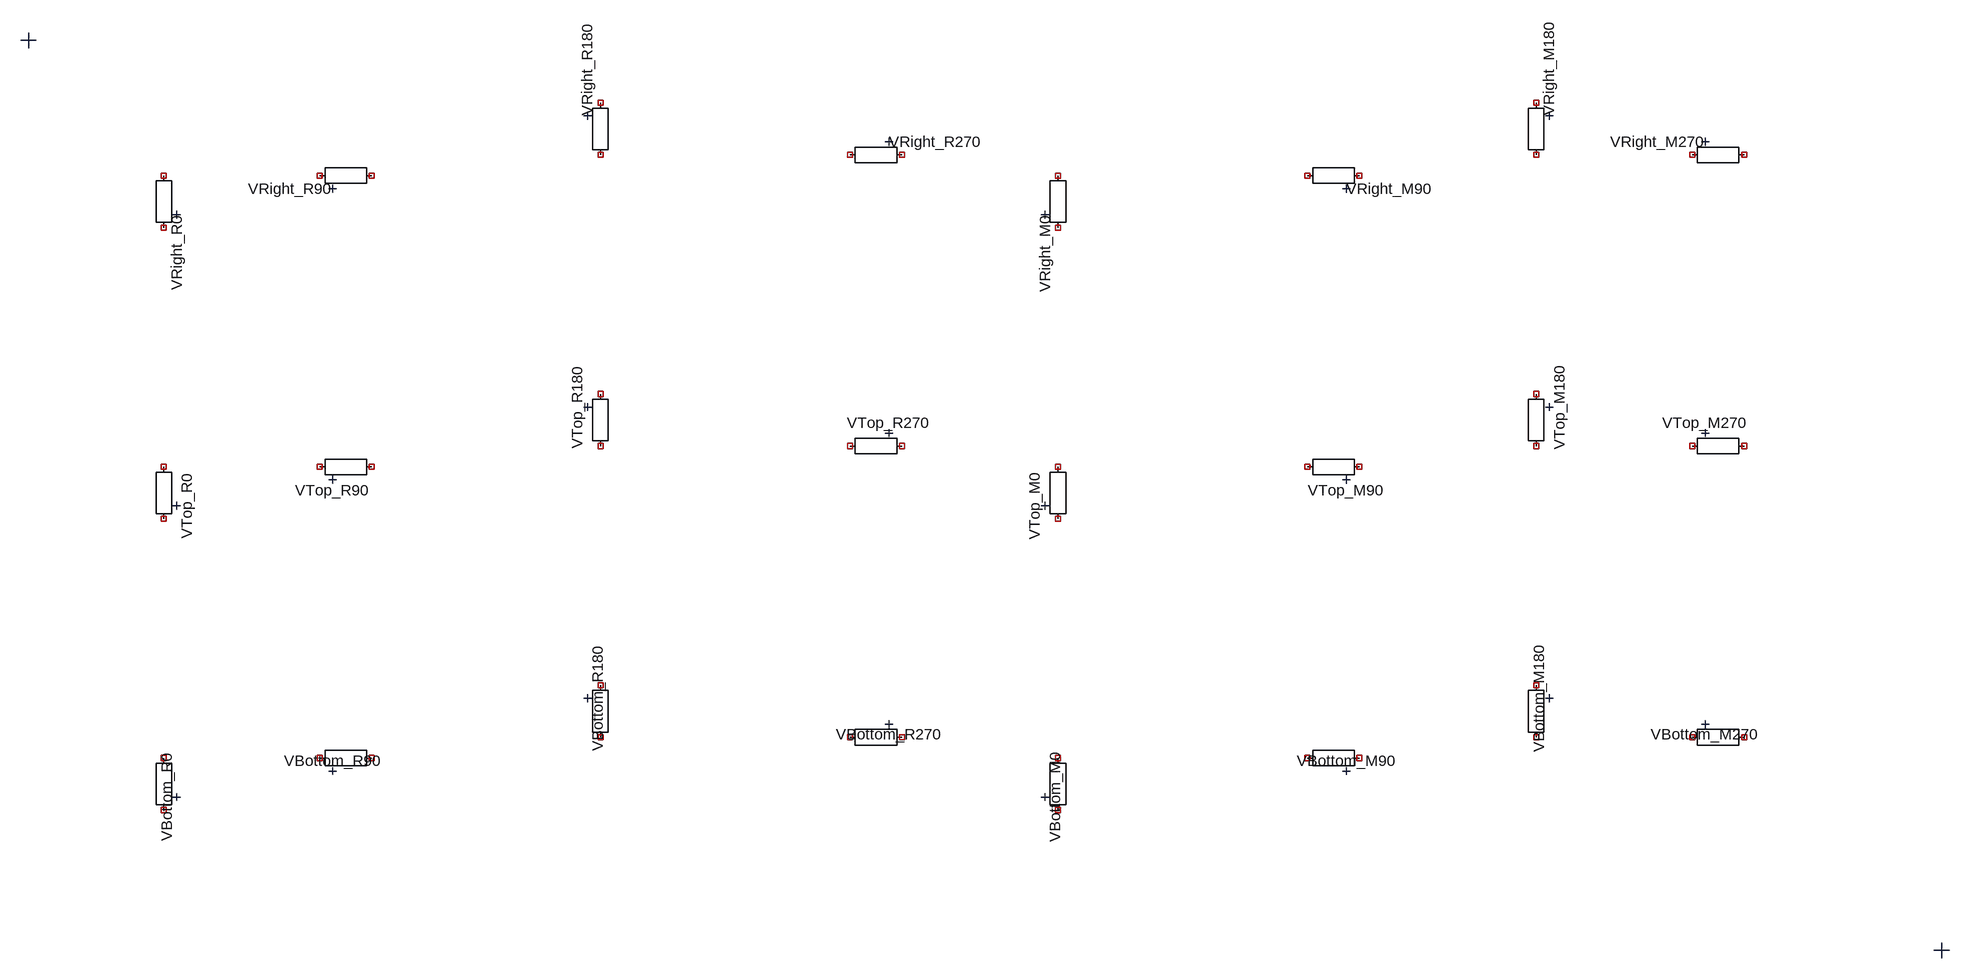
[diagram p0: schematic attributes_vright_vtop_vbottom.asc]
attributes_vright_vtop_vbottom.asc, the LTspice schematic file:
Version 4
SHEET 1 2400 1600
WIRE -12 0 12 0
WIRE 0 -12 0 12
WIRE 2932 1400 2956 1400
WIRE 2944 1388 2944 1412
WIRE 222 268 234 268
WIRE 228 262 228 274
SYMBOL res 192 192 R0
WINDOW 0 0 0 Invisible 2
WINDOW 3 36 76 VRight 2
SYMATTR InstName R1
SYMATTR Value VRight_R0
WIRE 462 228 474 228
WIRE 468 222 468 234
SYMBOL res 544 192 R90
WINDOW 0 0 0 Invisible 2
WINDOW 3 36 76 VRight 2
SYMATTR InstName R2
SYMATTR Value VRight_R90
WIRE 854 116 866 116
WIRE 860 110 860 122
SYMBOL res 896 192 R180
WINDOW 0 0 0 Invisible 2
WINDOW 3 36 76 VRight 2
SYMATTR InstName R3
SYMATTR Value VRight_R180
WIRE 1318 156 1330 156
WIRE 1324 150 1324 162
SYMBOL res 1248 192 R270
WINDOW 0 0 0 Invisible 2
WINDOW 3 36 76 VRight 2
SYMATTR InstName R4
SYMATTR Value VRight_R270
WIRE 1558 268 1570 268
WIRE 1564 262 1564 274
SYMBOL res 1600 192 M0
WINDOW 0 0 0 Invisible 2
WINDOW 3 36 76 VRight 2
SYMATTR InstName R5
SYMATTR Value VRight_M0
WIRE 2022 228 2034 228
WIRE 2028 222 2028 234
SYMBOL res 1952 192 M90
WINDOW 0 0 0 Invisible 2
WINDOW 3 36 76 VRight 2
SYMATTR InstName R6
SYMATTR Value VRight_M90
WIRE 2334 116 2346 116
WIRE 2340 110 2340 122
SYMBOL res 2304 192 M180
WINDOW 0 0 0 Invisible 2
WINDOW 3 36 76 VRight 2
SYMATTR InstName R7
SYMATTR Value VRight_M180
WIRE 2574 156 2586 156
WIRE 2580 150 2580 162
SYMBOL res 2656 192 M270
WINDOW 0 0 0 Invisible 2
WINDOW 3 36 76 VRight 2
SYMATTR InstName R8
SYMATTR Value VRight_M270
WIRE 222 716 234 716
WIRE 228 710 228 722
SYMBOL res 192 640 R0
WINDOW 0 0 0 Invisible 2
WINDOW 3 36 76 VTop 2
SYMATTR InstName R9
SYMATTR Value VTop_R0
WIRE 462 676 474 676
WIRE 468 670 468 682
SYMBOL res 544 640 R90
WINDOW 0 0 0 Invisible 2
WINDOW 3 36 76 VTop 2
SYMATTR InstName R10
SYMATTR Value VTop_R90
WIRE 854 564 866 564
WIRE 860 558 860 570
SYMBOL res 896 640 R180
WINDOW 0 0 0 Invisible 2
WINDOW 3 36 76 VTop 2
SYMATTR InstName R11
SYMATTR Value VTop_R180
WIRE 1318 604 1330 604
WIRE 1324 598 1324 610
SYMBOL res 1248 640 R270
WINDOW 0 0 0 Invisible 2
WINDOW 3 36 76 VTop 2
SYMATTR InstName R12
SYMATTR Value VTop_R270
WIRE 1558 716 1570 716
WIRE 1564 710 1564 722
SYMBOL res 1600 640 M0
WINDOW 0 0 0 Invisible 2
WINDOW 3 36 76 VTop 2
SYMATTR InstName R13
SYMATTR Value VTop_M0
WIRE 2022 676 2034 676
WIRE 2028 670 2028 682
SYMBOL res 1952 640 M90
WINDOW 0 0 0 Invisible 2
WINDOW 3 36 76 VTop 2
SYMATTR InstName R14
SYMATTR Value VTop_M90
WIRE 2334 564 2346 564
WIRE 2340 558 2340 570
SYMBOL res 2304 640 M180
WINDOW 0 0 0 Invisible 2
WINDOW 3 36 76 VTop 2
SYMATTR InstName R15
SYMATTR Value VTop_M180
WIRE 2574 604 2586 604
WIRE 2580 598 2580 610
SYMBOL res 2656 640 M270
WINDOW 0 0 0 Invisible 2
WINDOW 3 36 76 VTop 2
SYMATTR InstName R16
SYMATTR Value VTop_M270
WIRE 222 1164 234 1164
WIRE 228 1158 228 1170
SYMBOL res 192 1088 R0
WINDOW 0 0 0 Invisible 2
WINDOW 3 36 76 VBottom 2
SYMATTR InstName R17
SYMATTR Value VBottom_R0
WIRE 462 1124 474 1124
WIRE 468 1118 468 1130
SYMBOL res 544 1088 R90
WINDOW 0 0 0 Invisible 2
WINDOW 3 36 76 VBottom 2
SYMATTR InstName R18
SYMATTR Value VBottom_R90
WIRE 854 1012 866 1012
WIRE 860 1006 860 1018
SYMBOL res 896 1088 R180
WINDOW 0 0 0 Invisible 2
WINDOW 3 36 76 VBottom 2
SYMATTR InstName R19
SYMATTR Value VBottom_R180
WIRE 1318 1052 1330 1052
WIRE 1324 1046 1324 1058
SYMBOL res 1248 1088 R270
WINDOW 0 0 0 Invisible 2
WINDOW 3 36 76 VBottom 2
SYMATTR InstName R20
SYMATTR Value VBottom_R270
WIRE 1558 1164 1570 1164
WIRE 1564 1158 1564 1170
SYMBOL res 1600 1088 M0
WINDOW 0 0 0 Invisible 2
WINDOW 3 36 76 VBottom 2
SYMATTR InstName R21
SYMATTR Value VBottom_M0
WIRE 2022 1124 2034 1124
WIRE 2028 1118 2028 1130
SYMBOL res 1952 1088 M90
WINDOW 0 0 0 Invisible 2
WINDOW 3 36 76 VBottom 2
SYMATTR InstName R22
SYMATTR Value VBottom_M90
WIRE 2334 1012 2346 1012
WIRE 2340 1006 2340 1018
SYMBOL res 2304 1088 M180
WINDOW 0 0 0 Invisible 2
WINDOW 3 36 76 VBottom 2
SYMATTR InstName R23
SYMATTR Value VBottom_M180
WIRE 2574 1052 2586 1052
WIRE 2580 1046 2580 1058
SYMBOL res 2656 1088 M270
WINDOW 0 0 0 Invisible 2
WINDOW 3 36 76 VBottom 2
SYMATTR InstName R24
SYMATTR Value VBottom_M270

The netlist it stands for:
* attributes_vright_vtop_vbottom.asc
R1 NC_01 NC_02 VRight_R0
R2 NC_03 NC_04 VRight_R90
R3 NC_05 NC_06 VRight_R180
R4 NC_07 NC_08 VRight_R270
R5 NC_09 NC_10 VRight_M0
R6 NC_11 NC_12 VRight_M90
R7 NC_13 NC_14 VRight_M180
R8 NC_15 NC_16 VRight_M270
R9 NC_17 NC_18 VTop_R0
R10 NC_19 NC_20 VTop_R90
R11 NC_21 NC_22 VTop_R180
R12 NC_23 NC_24 VTop_R270
R13 NC_25 NC_26 VTop_M0
R14 NC_27 NC_28 VTop_M90
R15 NC_29 NC_30 VTop_M180
R16 NC_31 NC_32 VTop_M270
R17 NC_33 NC_34 VBottom_R0
R18 NC_35 NC_36 VBottom_R90
R19 NC_37 NC_38 VBottom_R180
R20 NC_39 NC_40 VBottom_R270
R21 NC_41 NC_42 VBottom_M0
R22 NC_43 NC_44 VBottom_M90
R23 NC_45 NC_46 VBottom_M180
R24 NC_47 NC_48 VBottom_M270
.backanno
.end